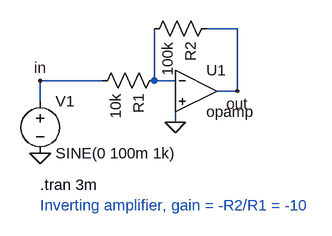
[diagram p0: schematic opamp_inverting.asc]
opamp_inverting.asc, the LTspice schematic file:
Version 4
SHEET 1 880 680
WIRE 240 96 240 176
WIRE 368 96 320 96
WIRE 368 192 368 96
WIRE 336 192 368 192
WIRE 240 176 272 176
WIRE 272 208 272 240
WIRE 64 176 64 208
WIRE 160 176 64 176
FLAG 272 240 0
FLAG 64 288 0
FLAG 64 176 in
FLAG 368 192 out
SYMBOL Opamps\opamp 304 128 R0
SYMATTR InstName U1
SYMBOL res 256 160 R90
SYMATTR InstName R1
SYMATTR Value 10k
SYMBOL res 336 80 R90
SYMATTR InstName R2
SYMATTR Value 100k
SYMBOL voltage 64 192 R0
SYMATTR InstName V1
SYMATTR Value SINE(0 100m 1k)
TEXT 64 336 Left 2 !.tran 3m
TEXT 64 368 Left 2 ;Inverting amplifier, gain = -R2/R1 = -10

The netlist it stands for:
* opamp_inverting.asc
XU1 N001 0 out opamp Aol=100K GBW=10Meg  ; pins invin noninvin out
R1 N001 in 10k
R2 out N001 100k
V1 in 0 SINE(0 100m 1k)
.tran 3m
* Inverting amplifier, gain = -R2/R1 = -10
.backanno
.end